# Altium schematic sheet Sheet1.SchDoc
size A4; SheetNumber: 1; SheetTotal: 1
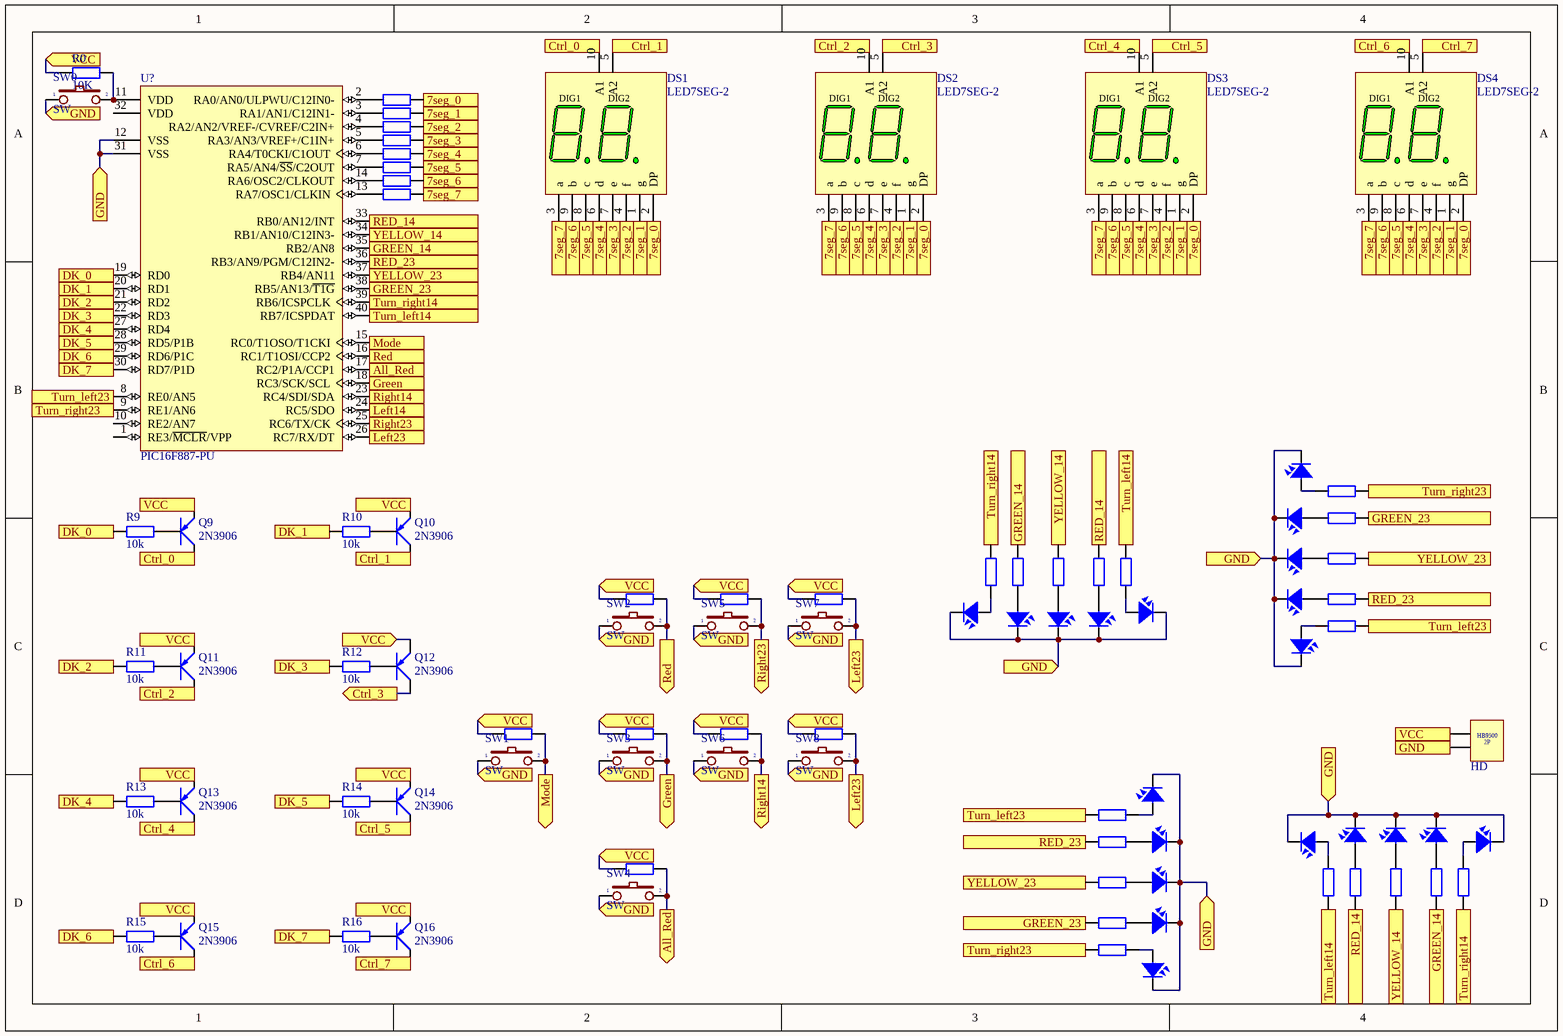
[diagram p0: Sheet1.SchDoc]

## Parts
DS1  LED7SEG-2  [LED7SEG-2-0.36]
DS2  LED7SEG-2  [LED7SEG-2-0.36]
DS3  LED7SEG-2  [LED7SEG-2-0.36]
DS4  LED7SEG-2  [LED7SEG-2-0.36]
GREEN1  LED  [LED-3MM-GREEN]  (value not drawn)
GREEN1L  LED  [LED-3MM-GREEN]  (value not drawn)
GREEN1R  LED  [LED-3MM-GREEN]  (value not drawn)
GREEN2  LED  [LED-3MM-GREEN]  (value not drawn)
GREEN2L  LED  [LED-3MM-GREEN]  (value not drawn)
GREEN2R  LED  [LED-3MM-GREEN]  (value not drawn)
GREEN3  LED  [LED-3MM-GREEN]  (value not drawn)
GREEN3L  LED  [LED-3MM-GREEN]  (value not drawn)
GREEN3R  LED  [LED-3MM-GREEN]  (value not drawn)
GREEN4  LED  [LED-3MM-GREEN]  (value not drawn)
GREEN4L  LED  [LED-3MM-GREEN]  (value not drawn)
GREEN4R  LED  [LED-3MM-GREEN]  (value not drawn)
HD  HB9500-2P  [HB9500-2P]  (value not drawn)
Q9  2N3906  [TO92-123]
Q10  2N3906  [TO92-123]
Q11  2N3906  [TO92-123]
Q12  2N3906  [TO92-123]
Q13  2N3906  [TO92-123]
Q14  2N3906  [TO92-123]
Q15  2N3906  [TO92-123]
Q16  2N3906  [TO92-123]
R0  10K  [R1/2W]
R1  220  [R1/2W]  (value not drawn)
R2  220  [R1/2W]  (value not drawn)
R3  220  [R1/2W]  (value not drawn)
R4  220  [R1/2W]  (value not drawn)
R5  220  [R1/2W]  (value not drawn)
R6  220  [R1/2W]  (value not drawn)
R7  220  [R1/2W]  (value not drawn)
R8  220  [R1/2W]  (value not drawn)
R9  10k  [R1/2W]
R10  10k  [R1/2W]
R11  10k  [R1/2W]
R12  10k  [R1/2W]
R13  10k  [R1/2W]
R14  10k  [R1/2W]
R15  10k  [R1/2W]
R16  10k  [R1/2W]
R17  330  [R1/2W]  (value not drawn)
R18  330  [R1/2W]  (value not drawn)
R19  330  [R1/2W]  (value not drawn)
R20  330  [R1/2W]  (value not drawn)
R21  330  [R1/2W]  (value not drawn)
R22  330  [R1/2W]  (value not drawn)
R23  330  [R1/2W]  (value not drawn)
R24  330  [R1/2W]  (value not drawn)
R25  330  [R1/2W]  (value not drawn)
R26  330  [R1/2W]  (value not drawn)
R27  330  [R1/2W]  (value not drawn)
R28  330  [R1/2W]  (value not drawn)
R29  330  [R1/2W]  (value not drawn)
R30  330  [R1/2W]  (value not drawn)
R31  330  [R1/2W]  (value not drawn)
R32  330  [R1/2W]  (value not drawn)
R33  330  [R1/2W]  (value not drawn)
R34  330  [R1/2W]  (value not drawn)
R35  330  [R1/2W]  (value not drawn)
R36  330  [R1/2W]  (value not drawn)
R37  10k  [R1/2W]  (value not drawn)
R38  10k  [R1/2W]  (value not drawn)
R39  10k  [R1/2W]  (value not drawn)
R40  10k  [R1/2W]  (value not drawn)
R41  10k  [R1/2W]  (value not drawn)
R42  10k  [R1/2W]  (value not drawn)
R43  10k  [R1/2W]  (value not drawn)
R44  10k  [R1/2W]  (value not drawn)
RED1  LED  [LED-3MM-RED]  (value not drawn)
RED2  LED  [LED-3MM-RED]  (value not drawn)
RED3  LED  [LED-3MM-RED]  (value not drawn)
RED4  LED  [LED-3MM-RED]  (value not drawn)
SW0  SW  [SW2]
SW1  SW  [SW2]
SW2  SW  [SW2]
SW3  SW  [SW2]
SW4  SW  [SW2]
SW5  SW  [SW2]
SW6  SW  [SW2]
SW7  SW  [SW2]
SW8  SW  [SW2]
U?  PIC16F887-PU  [DIP40/W0.6]
YELLOW1  LED  [LED-3MM-YELLOW]  (value not drawn)
YELLOW2  LED  [LED-3MM-YELLOW]  (value not drawn)
YELLOW3  LED  [LED-3MM-YELLOW]  (value not drawn)
YELLOW4  LED  [LED-3MM-YELLOW]  (value not drawn)

## Ports
7seg_0 (in), 7seg_0 (out), 7seg_1 (in), 7seg_1 (out), 7seg_2 (in), 7seg_2 (out), 7seg_3 (in), 7seg_3 (out), 7seg_4 (in), 7seg_4 (out), 7seg_5 (in), 7seg_5 (out), 7seg_6 (in), 7seg_6 (out), 7seg_7 (in), 7seg_7 (out), All_Red (in), All_Red (out), Ctrl_0 (in), Ctrl_0 (out), Ctrl_1 (in), Ctrl_1 (out), Ctrl_2 (in), Ctrl_2 (out), Ctrl_3 (in), Ctrl_3 (out), Ctrl_4 (in), Ctrl_4 (out), Ctrl_5 (in), Ctrl_5 (out), Ctrl_6 (in), Ctrl_6 (out), Ctrl_7 (in), Ctrl_7 (out), DK_0 (in), DK_0 (out), DK_1 (in), DK_1 (out), DK_2 (in), DK_2 (out), DK_3 (in), DK_3 (out), DK_4 (in), DK_4 (out), DK_5 (in), DK_5 (out), DK_6 (in), DK_6 (out), DK_7 (in), DK_7 (out), GND (in), GND (out), Green (in), Green (out), GREEN_14 (in), GREEN_14 (out), GREEN_23 (in), GREEN_23 (out), Left14 (in), Left23 (in), Left23 (out), Mode (in), Mode (out), Red (in), Red (out), RED_14 (in), RED_14 (out), RED_23 (in), RED_23 (out), Right14 (in), Right14 (out), Right23 (in), Right23 (out), Turn_left14 (in), Turn_left14 (out), Turn_left23 (in), Turn_left23 (out), Turn_right14 (in), Turn_right14 (out), Turn_right23 (in), Turn_right23 (out), VCC (in), VCC (out), YELLOW_14 (in), YELLOW_14 (out), YELLOW_23 (in), YELLOW_23 (out)

## Nets
7seg_0: DS1.2(DP) DS2.2(DP) DS3.2(DP) DS4.2(DP) R1.2 ; port 7seg_0
7seg_1: DS1.1(g) DS2.1(g) DS3.1(g) DS4.1(g) R2.2 ; port 7seg_1
7seg_2: DS1.4(f) DS2.4(f) DS3.4(f) DS4.4(f) R3.2 ; port 7seg_2
7seg_3: DS1.7(e) DS2.7(e) DS3.7(e) DS4.7(e) R4.2 ; port 7seg_3
7seg_4: DS1.6(d) DS2.6(d) DS3.6(d) DS4.6(d) R5.2 ; port 7seg_4
7seg_5: DS1.8(c) DS2.8(c) DS3.8(c) DS4.8(c) R6.2 ; port 7seg_5
7seg_6: DS1.9(b) DS2.9(b) DS3.9(b) DS4.9(b) R7.2 ; port 7seg_6
7seg_7: DS1.3(a) DS2.3(a) DS3.3(a) DS4.3(a) R8.2 ; port 7seg_7
All_Red: R40.2 SW4.2 U?.17(RC2/P1A/CCP1) ; port All_Red
Ctrl_0: DS1.10(A1) Q9.3(C) ; port Ctrl_0
Ctrl_1: DS1.5(A2) Q10.3(C) ; port Ctrl_1
Ctrl_2: DS2.10(A1) Q11.3(C) ; port Ctrl_2
Ctrl_3: DS2.5(A2) Q12.3(C) ; port Ctrl_3
Ctrl_4: DS3.10(A1) Q13.3(C) ; port Ctrl_4
Ctrl_5: DS3.5(A2) Q14.3(C) ; port Ctrl_5
Ctrl_6: DS4.10(A1) Q15.3(C) ; port Ctrl_6
Ctrl_7: DS4.5(A2) Q16.3(C) ; port Ctrl_7
DK_0: R9.1 U?.19(RD0) ; port DK_0
DK_1: R10.1 U?.20(RD1) ; port DK_1
DK_2: R11.1 U?.21(RD2) ; port DK_2
DK_3: R12.1 U?.22(RD3) ; port DK_3
DK_4: R13.1 U?.27(RD4) ; port DK_4
DK_5: R14.1 U?.28(RD5/P1B) ; port DK_5
DK_6: R15.1 U?.29(RD6/P1C) ; port DK_6
DK_7: R16.1 U?.30(RD7/P1D) ; port DK_7
GND: GREEN1.2 GREEN1L.2 GREEN1R.2 GREEN2.2 GREEN2L.2 GREEN2R.2 GREEN3.2 GREEN3L.2 GREEN3R.2 GREEN4.2 GREEN4L.2 GREEN4R.2 HD.2 RED1.2 RED2.2 RED3.2 RED4.2 SW0.1 SW1.1 SW2.1 SW3.1 SW4.1 SW5.1 SW6.1 SW7.1 SW8.1 U?.12(VSS) U?.31(VSS) YELLOW1.2 YELLOW2.2 YELLOW3.2 YELLOW4.2 ; port GND
Green: R39.2 SW3.2 U?.18(RC3/SCK/SCL) ; port Green
GREEN_14: R18.2 R33.2 U?.35(RB2/AN8) ; port GREEN_14
GREEN_23: R23.1 R28.2 U?.38(RB5/AN13/~{T1G}) ; port GREEN_23
Left14: U?.24(RC5/SDO) ; port Left14
Left23: R43.2 R44.2 SW7.2 SW8.2 U?.26(RC7/RX/DT) ; port Left23
Mode: R37.2 SW1.2 U?.15(RC0/T1OSO/T1CKI) ; port Mode
Red: R38.2 SW2.2 U?.16(RC1/T1OSI/CCP2) ; port Red
RED_14: R20.2 R35.2 U?.33(RB0/AN12/INT) ; port RED_14
RED_23: R25.1 R30.2 U?.36(RB3/AN9/PGM/C12IN2-) ; port RED_23
Right14: R42.2 SW6.2 U?.23(RC4/SDI/SDA) ; port Right14
Right23: R41.2 SW5.2 U?.25(RC6/TX/CK) ; port Right23
Turn_left14: R21.2 R36.2 U?.40(RB7/ICSPDAT) ; port Turn_left14
Turn_left23: R26.1 R31.2 U?.8(RE0/AN5) ; port Turn_left23
Turn_right14: R17.2 R32.2 U?.39(RB6/ICSPCLK) ; port Turn_right14
Turn_right23: R22.1 R27.2 U?.9(RE1/AN6) ; port Turn_right23
VCC: HD.1 Q9.1(E) Q10.1(E) Q11.1(E) Q12.1(E) Q13.1(E) Q14.1(E) Q15.1(E) Q16.1(E) R0.1 R37.1 R38.1 R39.1 R40.1 R41.1 R42.1 R43.1 R44.1 ; port VCC
YELLOW_14: R19.2 R34.2 U?.34(RB1/AN10/C12IN3-) ; port YELLOW_14
YELLOW_23: R24.1 R29.2 U?.37(RB4/AN11) ; port YELLOW_23
NetGREEN1_1: GREEN1.1 R18.1
NetGREEN1L_1: GREEN1L.1 R21.1
NetGREEN1R_1: GREEN1R.1 R17.1
NetGREEN2_1: GREEN2.1 R23.2
NetGREEN2L_1: GREEN2L.1 R26.2
NetGREEN2R_1: GREEN2R.1 R22.2
NetGREEN3_1: GREEN3.1 R28.1
NetGREEN3L_1: GREEN3L.1 R31.1
NetGREEN3R_1: GREEN3R.1 R27.1
NetGREEN4_1: GREEN4.1 R33.1
NetGREEN4L_1: GREEN4L.1 R36.1
NetGREEN4R_1: GREEN4R.1 R32.1
NetQ9_2: Q9.2(B) R9.2
NetQ10_2: Q10.2(B) R10.2
NetQ11_2: Q11.2(B) R11.2
NetQ12_2: Q12.2(B) R12.2
NetQ13_2: Q13.2(B) R13.2
NetQ14_2: Q14.2(B) R14.2
NetQ15_2: Q15.2(B) R15.2
NetQ16_2: Q16.2(B) R16.2
NetR0_2: R0.2 SW0.2 U?.11(VDD)
NetR1_1: R1.1 U?.2(RA0/AN0/ULPWU/C12IN0-)
NetR2_1: R2.1 U?.3(RA1/AN1/C12IN1-)
NetR3_1: R3.1 U?.4(RA2/AN2/VREF-/CVREF/C2IN+)
NetR4_1: R4.1 U?.5(RA3/AN3/VREF+/C1IN+)
NetR5_1: R5.1 U?.6(RA4/T0CKI/C1OUT)
NetR6_1: R6.1 U?.7(RA5/AN4/~{SS}/C2OUT)
NetR7_1: R7.1 U?.14(RA6/OSC2/CLKOUT)
NetR8_1: R8.1 U?.13(RA7/OSC1/CLKIN)
NetR19_1: R19.1 YELLOW1.1
NetR20_1: R20.1 RED1.1
NetR24_2: R24.2 YELLOW2.1
NetR25_2: R25.2 RED2.1
NetR29_1: R29.1 YELLOW3.1
NetR30_1: R30.1 RED3.1
NetR34_1: R34.1 YELLOW4.1
NetR35_1: R35.1 RED4.1

Not connected (* = marked no-connect by the designer): U? 1(RE3/~{MCLR}/VPP) 10(RE2/AN7) 32(VDD)

## Notes on the sheet
- (in symbol HB9500-2P) HB9500; 2P
- (in symbol LED7SEG-2) DIG1; DIG2

## Library data of the parts
DS1-DS4 = LED7SEG-2: 9.2 mm Green 7-Segment Display: 2-Digit, RH DP; Published: 26-May-2004; LatestRevisionDate: 11-Oct-2004; LatestRevisionNote: Display outline superimposed on PCB Footprint.; DatasheetVersion: 14-Mar-2003; PackageVersion: 14-Mar-2003; PackageReference: HDSM-577; Publisher: Altium Limited; PackageDescription: LED, 7-Segment Display, 9.2 mm, Dual Digit; 10 Leads; Row Space 10.7 mm; Pitch 2.54 mm; ComponentLink1Description: Manufacturer Link; ComponentLink1URL: http://www.avagotech.com/
GREEN1 GREEN1L GREEN1R GREEN2 GREEN2L GREEN2R GREEN3 GREEN3L GREEN3R GREEN4 GREEN4L GREEN4R RED1-RED4 YELLOW1-YELLOW4 = LED: LED Single colour Green and Red; Value: LED 3 ly Single Colour
HD = HB9500-2P: Terminal Block, Header, 2P, 15A, 300VAC Rohs Compliant: Yes
Q9-Q16 = 2N3906: PNP 600mW, ECB; Value: A1015
R0-R44 = R1/4W: Resistor 1/4W; Value: R1/4W - 1K
SW0-SW8 = SW2: Switch button 2 pin; Value: SW chip 2 pin
U? = PIC16F887-PU: Flash-Based, 8-Bit CMOS Microcontroller with nanoWatt Technology, 8K (x14-Bit words) Program Memory, 624 Bytes Data Memory, 35 I/O pins, 40-Pin PDIP, Standard VDD Range, Extended Temperature; Published: 29-Jan-2009; LatestRevisionDate: 02-Dec-2009; LatestRevisionNote: Updated datasheet to version revF, Apr-2009.; DatasheetVersion: revF, Apr-2009; PackageVersion: revBB, Aug-2009; PackageReference: PDIP600-P40; Publisher: Altium Limited; PackageDescription: 40-Lead Plastic Dual In-Line (P) - 600 mil Body [PDIP]; Supplier 1: Digi-Key; Supplier Part Number 1: PIC16F887-E/P-ND; Supplier 2: Farnell; Supplier Part Number 2: 1703423; ComponentLink1Description: Datasheet; ComponentLink1URL: http://ww1.microchip.com/downloads/en/DeviceDoc/41291F.pdf; ComponentLink2Description: Packaging Specification; ComponentLink2URL: http://www.microchip.com/stellent/groups/techpub_sg/documents/packagingspec/en012702.pdf; ComponentLink3Description: Microchip.com Home; ComponentLink3URL: http://www.microchip.com/